# Altium project BLE_Lock_Brd_v1.0.PrjPcb (part 3 of 3)
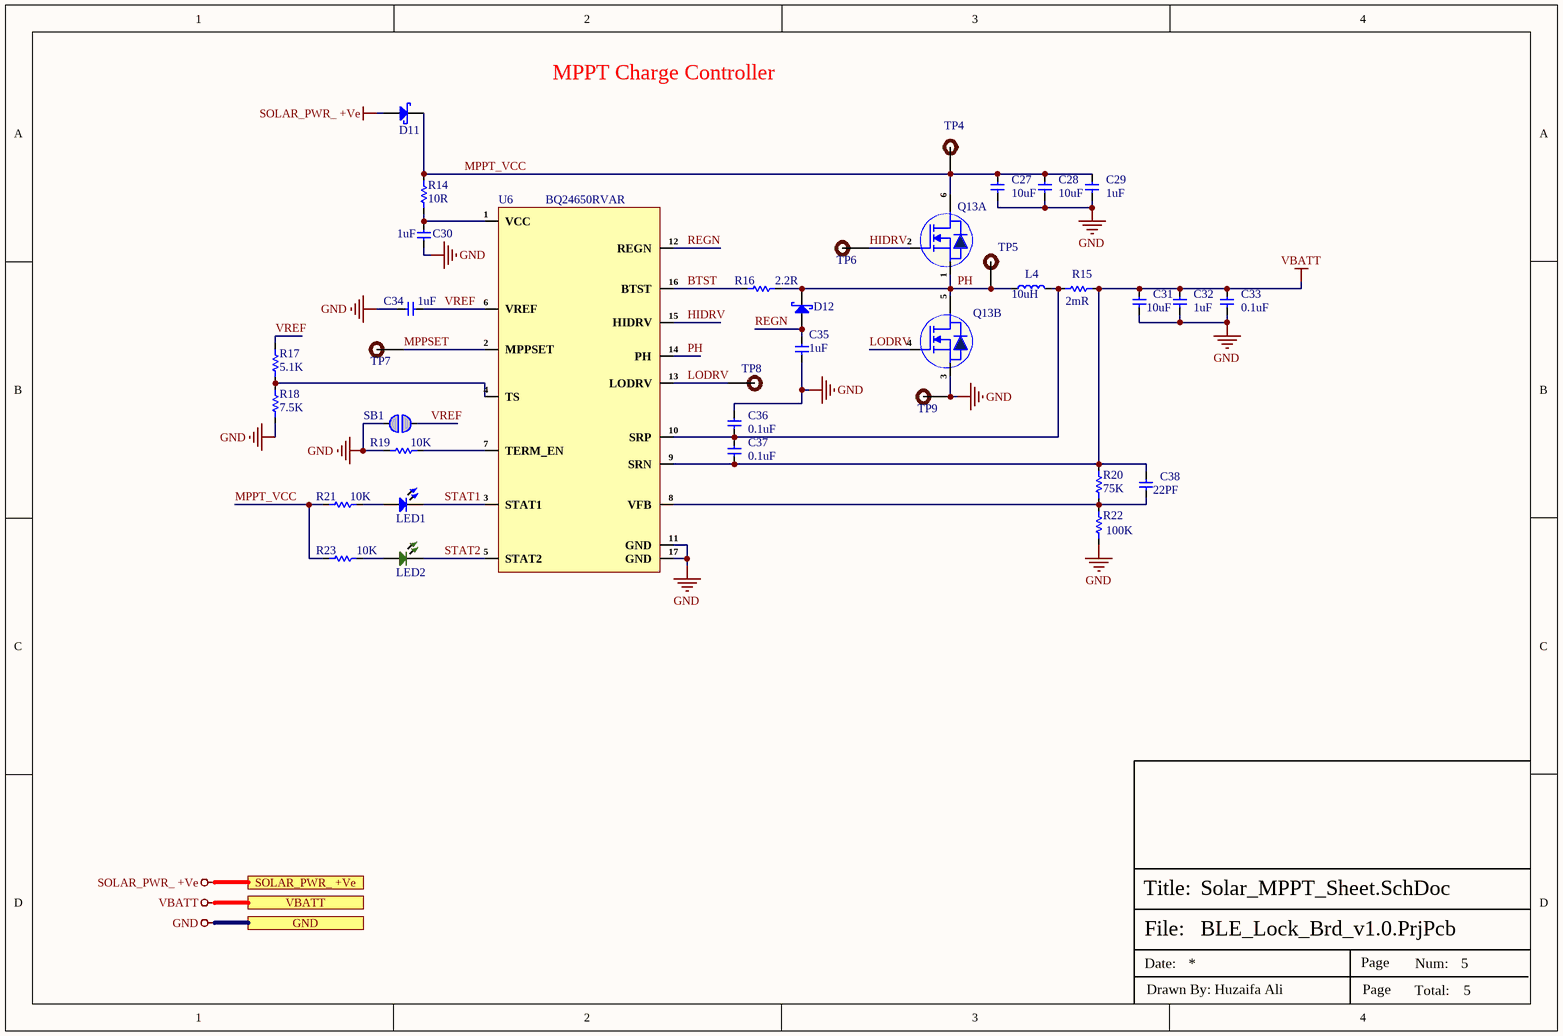
[diagram p5: Solar_MPPT_Sheet.SchDoc]

## Nets that join several sheets
BATT_GND: Power_Sheet (C7.1 C8.1 U2.1 U3.6), Connector_Sheet (C23.2 D3.1 J4.2)
GND: Power_Sheet (32 pins), Controller_Sheet (8 pins), Power_Switch_Sheet (12 pins), Connector_Sheet (5 pins), Solar_MPPT_Sheet (18 pins)
SOLAR_PWR_ +Ve: Connector_Sheet (C24.1 D8.2 J5.2), Solar_MPPT_Sheet (D11.2)
VBATT: Power_Sheet (9 pins), Controller_Sheet (J1.1 L3.2 U5.19 U5.23), Connector_Sheet (C23.1 D3.2 J4.1), Solar_MPPT_Sheet (8 pins)
VBOOST: Power_Sheet (6 pins), Connector_Sheet (13 pins)
VBOOST1: Power_Sheet (6 pins), Connector_Sheet (7 pins)
BOOST_EN1: Power_Sheet (C9.2 R4.2 U1.3), Controller_Sheet (U5.22)
BOOST_EN2: Power_Sheet (C18.2 R9.2 U4.3), Controller_Sheet (U5.20)
E_LOCK 1: Power_Switch_Sheet (Q1.2 Q1.4), Connector_Sheet (D4.1 J2.2)
E_LOCK 2: Power_Switch_Sheet (Q3.2 Q3.4), Connector_Sheet (D5.1 J2.4)
E_LOCK 3: Power_Switch_Sheet (Q5.2 Q5.4), Connector_Sheet (D6.1 J2.6)
E_LOCK 4: Power_Switch_Sheet (Q7.2 Q7.4), Connector_Sheet (D7.1 J2.8)
E_LOCK 5: Power_Switch_Sheet (Q9.2 Q9.4), Connector_Sheet (D9.1 J2.10)
E_LOCK 6: Power_Switch_Sheet (Q11.2 Q11.4), Connector_Sheet (D10.1 J2.12)
GPIO1: Controller_Sheet (U5.1), Power_Switch_Sheet (Q1.1)
GPIO2: Controller_Sheet (U5.2), Power_Switch_Sheet (Q3.1)
GPIO3: Controller_Sheet (U5.3), Power_Switch_Sheet (Q5.1)
GPIO4: Controller_Sheet (U5.4), Power_Switch_Sheet (Q7.1)
GPIO5: Controller_Sheet (U5.6), Power_Switch_Sheet (Q9.1)
GPIO6: Controller_Sheet (U5.7), Power_Switch_Sheet (Q11.1)
GPIO7: Controller_Sheet (U5.8), Power_Switch_Sheet (Q2.1)
GPIO8: Controller_Sheet (U5.9), Power_Switch_Sheet (Q4.1)
GPIO9: Controller_Sheet (U5.10), Power_Switch_Sheet (Q6.1)
GPIO12: Controller_Sheet (U5.15), Power_Switch_Sheet (Q8.1)
GPIO13: Controller_Sheet (U5.16), Power_Switch_Sheet (Q10.1)
GPIO14: Controller_Sheet (U5.17), Power_Switch_Sheet (Q12.1)
LED_PWR_N_1: Power_Switch_Sheet (Q2.2 Q2.4), Connector_Sheet (J3.2)
LED_PWR_N_2: Power_Switch_Sheet (Q4.2 Q4.4), Connector_Sheet (J3.4)
LED_PWR_N_3: Power_Switch_Sheet (Q6.2 Q6.4), Connector_Sheet (J3.6)
LED_PWR_N_4: Power_Switch_Sheet (Q8.2 Q8.4), Connector_Sheet (J3.8)
LED_PWR_N_5: Power_Switch_Sheet (Q10.2 Q10.4), Connector_Sheet (J3.10)
LED_PWR_N_6: Power_Switch_Sheet (Q12.2 Q12.4), Connector_Sheet (J3.12)